# Altium schematic sheet rev-b1_case_boost.SchDoc
size 297 x 209 mm; Symbol: Drawing-Symbol_A4; @Project Name: Atrium_RevB1; @Page Count: 2; @Update Date: 2026-11-06; @Create Date: 2026-11-06; @Schematic Name: Case_Schematic; @Page No: 2; @Page Name: P1; Company: Local Forge; Version: V1.0; Page Size: A4; Drawn: Het Bhavsar; Device: Drawing-Symbol_A4; @Create Time: 01:02:57; @Update Time: 01:02:57; Border: 1; Width: 1170; Height: 825; Region Start: 1; X Region Count: 6; Y Region Count: 4; Blade Width: 10; Title Block Position: 3; @Board Name: Case
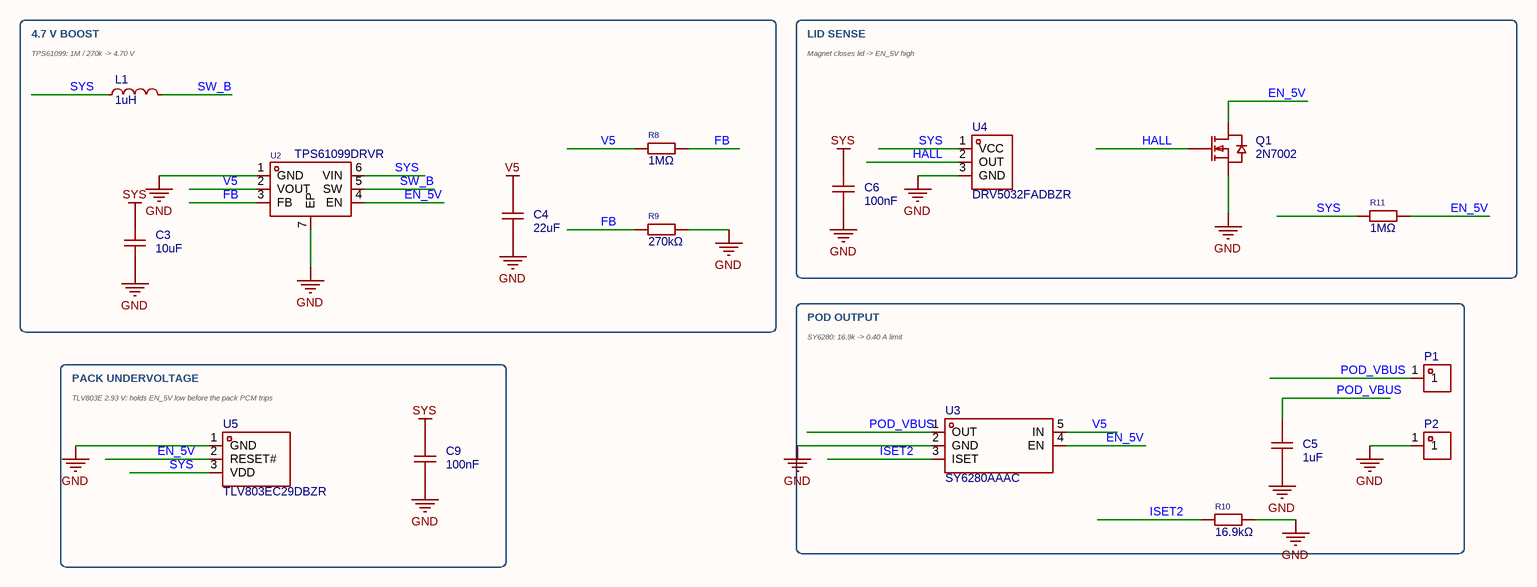
[diagram p0: rev-b1_case_boost.SchDoc]

## Parts
C3  10uF  [C0603]
C4  22uF  [C0603]
C5  1uF  [C0402]
C6  100nF  [C0402]
C9  100nF  [C0402]
L1  1uH  [L0806]
P1  BWCD-L4.5W2.0H2.3  [TESTPOINT-SMD_BD2.0-H4.5]  (value not drawn)
P2  BWCD-L4.5W2.0H2.3  [TESTPOINT-SMD_BD2.0-H4.5]  (value not drawn)
Q1  2N7002  [SOT-23-3_L2.9-W1.3-P1.90-LS2.4-BR]
R8  1MΩ  [R0402]
R9  270kΩ  [R0402]
R10  16.9kΩ  [R0402]
R11  1MΩ  [R0402]
U2  TPS61099DRVR  [WSON-6_L2.0-W2.0-P0.65-TL-EP]
U3  SY6280AAAC  [TSOT-23-5_L2.9-W1.6-P0.95-LS2.8-BL]
U4  DRV5032FADBZR  [SOT-23-3_L2.9-W1.3-P0.95-LS2.4-BR]
U5  TLV803EC29DBZR  [SOT-23-3_L2.9-W1.3-P1.90-LS2.4-BR]

## Blocks framed on the sheet
4.7 V BOOST: C3 C4 L1 R8 R9 U2
LID SENSE: C6 Q1 R11 U4
POD OUTPUT: C5 P1 P2 R10 U3
PACK UNDERVOLTAGE: C9 U5

## Nets
GND: C3.2 C4.2 C5.2 C6.2 C9.2 P2.1 Q1.2(S) R9.2 R10.2 U2.1(GND) U2.7(EP) U3.2(GND) U4.3(GND) U5.1(GND)
SYS: C3.1 C6.1 C9.1 L1.1 R11.1 U2.6(VIN) U4.1(VCC) U5.3(VDD)
V5: C4.1 R8.1 U2.2(VOUT) U3.5(IN)
EN_5V: Q1.3(D) R11.2 U2.4(EN) U3.4(EN) U5.2(RESET#)
FB: R8.2 R9.1 U2.3(FB)
HALL: Q1.1(G) U4.2(OUT)
ISET2: R10.1 U3.3(ISET)
POD_VBUS: C5.1 P1.1 U3.1(OUT)
SW_B: L1.2 U2.5(SW)

## Notes on the sheet
- (near L1) TPS61099: 1M / 270k -> 4.70 V
- Magnet closes lid -> EN_5V high
- SY6280: 16.9k -> 0.40 A limit
- (near U5) TLV803E 2.93 V: holds EN_5V low before the pack PCM trips
- Create at
- 2026-11-06
- Schematic
- Board
- Case_Schematic
- Case
- Update at
- Page
- P1
- Drawn
- Reviewed
- Het Bhavsar
- Atrium_RevB1
- Version
- V1.0
- Size
- A4
- Page  2  Total  2
- Local Forge

## Library data of the parts
C3 = CL10A106KP8NNNC: Capacitance:10uF Tolerance:±10% Tolerance:±10% Voltage Rating:10V Temperature Coefficient:X5R; Manufacturer: SAMSUNG(三星); Add into BOM: yes; Tolerance: ±10%; Voltage Rating: 10V; Temperature Coefficient: X5R; ModelId: 624118aa3cc7497086c383c2d72e08520819f05c4eef4c71ace90d822a990e87; ModelName: C0603_L1.6-W0.8-H0.8; ModelTransform: 62.992,31.496,0,0,0,0,0,0,0; Symbol: CL10A106KP8NNNC; Device: CL10A106KP8NNNC; Convert to PCB: yes; Manufacturer Part: CL10A106KP8NNNC; Supplier: LCSC; Supplier Part: C19702; LCSC Part Name: 10uF ±10% 10V; Supplier Footprint: 0603; JLCPCB Part Class: Basic Part; Datasheet: https://item.szlcsc.com/datasheet/CL10A106KP8NNNC/20411.html; Value: 10uF; FootprintName: C0603
C4 = CL10A226MQ8NRNC: Capacitance:22uF Tolerance:±20% Tolerance:±20% Voltage Rating:6.3V Temperature Coefficient:X5R; Manufacturer: SAMSUNG(三星); Add into BOM: yes; Tolerance: ±20%; Voltage Rating: 6.3V; Temperature Coefficient: X5R; ModelId: 624118aa3cc7497086c383c2d72e08520819f05c4eef4c71ace90d822a990e87; ModelName: C0603_L1.6-W0.8-H0.8; ModelTransform: 62.992,31.496,0,0,0,0,0,0,0; Symbol: CL10A226MQ8NRNC; Device: CL10A226MQ8NRNC; Convert to PCB: yes; Manufacturer Part: CL10A226MQ8NRNC; Supplier: LCSC; Supplier Part: C59461; LCSC Part Name: 22uF ±20% 6.3V; Supplier Footprint: 0603; JLCPCB Part Class: Basic Part; Datasheet: https://item.szlcsc.com/datasheet/CL10A226MQ8NRNC/60514.html; Value: 22uF; FootprintName: C0603
C5 = CL05A105KA5NQNC: Capacitance:1uF Tolerance:±10% Tolerance:±10% Voltage Rating:25V Temperature Coefficient:X5R; Manufacturer: SAMSUNG(三星); Add into BOM: yes; Tolerance: ±10%; Voltage Rating: 25V; Temperature Coefficient: X5R; ModelId: b7d13df3e9464d7a99d0651d1a5b4d570819f05c4eef4c71ace90d822a990e87; ModelName: C0402_L1.0-W0.5-H0.5; ModelTransform: 39.37,19.685,0,0,0,0,0,0,0; Symbol: CL05A105KA5NQNC; Device: CL05A105KA5NQNC; Convert to PCB: yes; Manufacturer Part: CL05A105KA5NQNC; Supplier: LCSC; Supplier Part: C52923; LCSC Part Name: 1uF ±10% 25V; Supplier Footprint: 0402; JLCPCB Part Class: Basic Part; Datasheet: https://item.szlcsc.com/datasheet/CL05A105KA5NQNC/53938.html; Value: 1uF; FootprintName: C0402
C6 = CL05B104KO5NNNC: Capacitance:100nF Tolerance:±10% Tolerance:±10% Voltage Rating:16V Temperature Coefficient:X7R; Manufacturer: SAMSUNG(三星); Add into BOM: yes; Tolerance: ±10%; Voltage Rating: 16V; Temperature Coefficient: X7R; ModelId: b7d13df3e9464d7a99d0651d1a5b4d570819f05c4eef4c71ace90d822a990e87; ModelName: C0402_L1.0-W0.5-H0.5; ModelTransform: 39.37,19.685,0,0,0,0,0,0,0; Symbol: CL05B104KO5NNNC; Device: CL05B104KO5NNNC; Convert to PCB: yes; Manufacturer Part: CL05B104KO5NNNC; Supplier: LCSC; Supplier Part: C1525; LCSC Part Name: 100nF ±10% 16V; Supplier Footprint: 0402; JLCPCB Part Class: Basic Part; Datasheet: https://item.szlcsc.com/datasheet/CL05B104KO5NNNC/1877.html; Value: 100nF; FootprintName: C0402
C9 = CL05B104KO5NNNC: Capacitance:100nF Tolerance:±10% Tolerance:±10% Voltage Rating:16V Temperature Coefficient:X7R; Manufacturer: SAMSUNG(三星); Add into BOM: yes; 3D Model: b7d13df3e9464d7a99d0651d1a5b4d570819f05c4eef4c71ace90d822a990e87; 3D Model Transform: 39.37,19.685,0,0,0,0,0,0,0; Tolerance: ±10%; Voltage Rating: 16V; Temperature Coefficient: X7R; ModelName: C0402_L1.0-W0.5-H0.5; Symbol: CL05B104KO5NNNC; Device: CL05B104KO5NNNC; Convert to PCB: yes; LCSC Part Name: 100nF ±10% 16V; Supplier Part: C1525; Manufacturer Part: CL05B104KO5NNNC; Supplier Footprint: 0402; JLCPCB Part Class: Basic Part; Datasheet: https://item.szlcsc.com/datasheet/CL05B104KO5NNNC/1877.html; Supplier: LCSC; Value: 100nF; FootprintName: C0402
L1 = DFE201610E-1R0M=P2: Inductance:1uH Tolerance:±20% Tolerance:±20% Current Rating:2.7A Current - Saturation (Isat):3.6A DC Resistance(DCR):57mΩ Q @ Frequency:- Frequency - Self Resonant:- Ratings:-; Manufacturer: muRata(村田); Add into BOM: yes; Tolerance: ±20%; Current Rating: 2.7A; Current - Saturation (Isat): 3.6A; DC Resistance(DCR): 57mΩ; ModelId: 50126e67425b4d0e857ac4e361b69b090819f05c4eef4c71ace90d822a990e87; ModelName: L0806_L2.0-W1.6-H1.0; ModelTransform: 78.74,62.992,0,0,0,0,0,0,0; Symbol: DFE201610E-1R0M=P2; Device: DFE201610E-1R0M=P2; Convert to PCB: yes; Manufacturer Part: DFE201610E-1R0M=P2; Supplier: LCSC; Supplier Part: C161082; LCSC Part Name: 1uH ±20% 3.6A; Supplier Footprint: 0806; JLCPCB Part Class: Extended Part; Datasheet: https://atta.szlcsc.com/upload/public/pdf/source/20180329/C161082_B32C8834554668ECFD54206075068FE7.pdf; Value: 1uH; Q @ Frequency: -; Frequency - Self Resonant: -; Ratings: -; FootprintName: L0806
P1 P2 = BWCD-L4.5W2.0H2.3: Type:Pogo Pin Number of Pins:1P Overall Length/Height:4.5mm Contact Resistance:30mΩ Elastic Life:1万次 Current Rating:1.5A Voltage Rating:36V Contact Material:Brass Contact Plating:Gold Operating Temperature:-45℃~+85℃ Operating Temperature:-45℃~+85℃; Manufacturer: BAT WIRELESS(蝙蝠无线); Add into BOM: yes; Overall Length/Height: 4.5mm; Contact Resistance: 30mΩ; Elastic Life: 1万次; Current Rating: 1.5A; Voltage Rating: 36V; Symbol: BWCD-L4.5W2.0H2.3; Device: BWCD-L4.5W2.0H2.3; Convert to PCB: yes; Manufacturer Part: BWCD-L4.5W2.0H2.3; Supplier: LCSC; Supplier Part: C2826546; LCSC Part Name: 天线顶针; Supplier Footprint: SMD,D=2mm; JLCPCB Part Class: Extended Part; Datasheet: https://item.szlcsc.com/datasheet/BWCD-L4.5W2.0H2.3/2970176.html; Type: Pogo Pin; Number of Pins: 1P; Contact Material: Brass; Contact Plating: Gold; Operating Temperature: -45℃~+85℃; FootprintName: TESTPOINT-SMD_BD2.0-H4.5
Q1 = 2N7002_C8545: Number:1 N-channel Drain to Source Voltage:60V Current - Continuous Drain(Id):115mA RDS(on):5Ω@10V Pd - Power Dissipation:225mW Gate Threshold Voltage (Vgs(th)):2.5V Gate Charge(Qg):- Input Capacitance(Ciss):50pF Reverse Transfer Capacitance (Crss@Vds):5p; Manufacturer: CJ(江苏长电/长晶); Add into BOM: yes; Drain to Source Voltage: 60V; Current - Continuous Drain(Id): 115mA; RDS(on): 5Ω@10V; Pd - Power Dissipation: 225mW; Gate Threshold Voltage (Vgs(th)): 2.5V; Input Capacitance(Ciss): 50pF; Reverse Transfer Capacitance (Crss@Vds): 5pF; Output Capacitance(Coss): 25pF; Vgs: ±20V; ModelId: 62a57c6760504a01965db6419a6d07df0819f05c4eef4c71ace90d822a990e87; ModelName: SOT-23-3P_L2.9-W1.3-H1.0-LS2.4-P0.95; ModelTransform: 98.425,114.173,0,180,0,0,0.0005,-0.0005,0; Symbol: 2N7002; Device: 2N7002_C8545; Convert to PCB: yes; Manufacturer Part: 2N7002; Supplier: LCSC; Supplier Part: C8545; LCSC Part Name: 1个N沟道 耐压:60V 电流:115mA; Supplier Footprint: SOT-23; JLCPCB Part Class: Basic Part; Datasheet: https://item.szlcsc.com/datasheet/2N7002/9040.html; Number: 1 N-channel; Gate Charge(Qg): -; Operating Temperature: -; Configuration: -; Type: N-Channel; FootprintName: SOT-23-3_L2.9-W1.3-P1.90-LS2.4-BR
R8 R11 = 0402WGF1004TCE: Type:Thick Film Resistor Resistance:1MΩ Tolerance:±1% Tolerance:±1% Power(Watts):62.5mW Voltage-Supply(Max):50V Temperature Coefficient:±100ppm/℃ Temperature Coefficient:±100ppm/℃ Operating Temperature:-55℃~+155℃ Operating Temperature:-55℃~+155℃; Manufacturer: UNI-ROYAL(厚声); Add into BOM: yes; Tolerance: ±1%; Power(Watts): 62.5mW; Voltage-Supply(Max): 50V; ModelId: efdecb7dae4442949d28eecaf748420f0819f05c4eef4c71ace90d822a990e87; ModelName: R0402_L1.0-W0.5-H0.4; ModelTransform: 39.37,19.685,0,0,0,0,0,0,0; Symbol: 0402WGF1004TCE; Device: 0402WGF1004TCE; Convert to PCB: yes; Manufacturer Part: 0402WGF1004TCE; Supplier: LCSC; Supplier Part: C26083; Value: 1MΩ; JLCPCB Part Class: Basic Part; LCSC Part Name: 1MΩ ±1% 62.5mW 厚膜电阻; Supplier Footprint: 0402; Datasheet: https://item.szlcsc.com/datasheet/0402WGF1004TCE/26826.html; Type: Thick Film Resistor; Temperature Coefficient: ±100ppm/℃; Operating Temperature: -55℃~+155℃; FootprintName: R0402
R9 = 0402WGF2703TCE: Type:Thick Film Resistors Resistance:270kΩ Tolerance:±1% Tolerance:±1% Power(Watts): Overload Voltage (Max): Temperature Coefficient:±100ppm/℃ Temperature Coefficient:±100ppm/℃ Operating Temperature Range:-55℃~+155℃ Operating Temperature Range:-55℃~+155℃; Manufacturer: UNI-ROYAL(厚声); Add into BOM: yes; Tolerance: ±1%; ModelId: efdecb7dae4442949d28eecaf748420f0819f05c4eef4c71ace90d822a990e87; ModelName: R0402_L1.0-W0.5-H0.4; ModelTransform: 39.37,19.685,0,0,0,0,0,0,0; Symbol: 0402WGF2703TCE; Device: 0402WGF2703TCE; Convert to PCB: yes; Manufacturer Part: 0402WGF2703TCE; Supplier: LCSC; Supplier Part: C25770; Value: 270kΩ; JLCPCB Part Class: Extended Part; LCSC Part Name: 270kΩ ±1% 62.5mW 厚膜电阻; Supplier Footprint: 0402; Datasheet: https://atta.szlcsc.com/upload/public/pdf/source/20200306/C422600_1E6D84923E4A46A82E41ADD87F860B5C.pdf; Type: Thick Film Resistors; Temperature Coefficient: ±100ppm/℃; Operating Temperature Range: -55℃~+155℃; FootprintName: R0402
R10 = 0402WGF1692TCE: Type:Thick Film Resistor Resistance:16.9kΩ Tolerance:±1% Tolerance:±1% Power(Watts):62.5mW Voltage-Supply(Max):50V Temperature Coefficient:±100ppm/℃ Temperature Coefficient:±100ppm/℃ Operating Temperature:-55℃~+155℃ Operating Temperature:-55℃~+155℃; Manufacturer: UNI-ROYAL(厚声); Add into BOM: yes; Tolerance: ±1%; Power(Watts): 62.5mW; Voltage-Supply(Max): 50V; ModelId: efdecb7dae4442949d28eecaf748420f0819f05c4eef4c71ace90d822a990e87; ModelName: R0402_L1.0-W0.5-H0.4; ModelTransform: 39.37,19.685,0,0,0,0,0,0,0; Symbol: 0402WGF1692TCE; Device: 0402WGF1692TCE; Convert to PCB: yes; Manufacturer Part: 0402WGF1692TCE; Supplier: LCSC; Supplier Part: C25858; Value: 16.9kΩ; JLCPCB Part Class: Extended Part; LCSC Part Name: 16.9kΩ ±1% 62.5mW 厚膜电阻; Supplier Footprint: 0402; Datasheet: https://item.szlcsc.com/datasheet/0402WGF1692TCE/26601.html; Type: Thick Film Resistor; Temperature Coefficient: ±100ppm/℃; Operating Temperature: -55℃~+155℃; FootprintName: R0402
U2 = TPS61099DRVR: Function:Boost Voltage - Supply:700mV~5.5V Voltage - Supply:700mV~5.5V Output Voltage:1.8V~5.5V Output Voltage:1.8V~5.5V Output Current:- Frequency - Switching:- Frequency - Switching:- Operating Temperature:-40℃~+150℃@(TJ) Operating Temperature:-40℃~+150; Manufacturer: TI(德州仪器); Add into BOM: yes; Function: Boost; Number of Outputs: 1; Quiescent Current: 1uA; Switch tube (built-in/external): Built-in; Output Type: Adjustable; ModelId: 8444490de3b54ad88c9bb3ba8e0898870819f05c4eef4c71ace90d822a990e87; ModelName: WSON-6_L2.0-W2.0-H0.8-P0.65; ModelTransform: 79.527,78.74,0,0,0,0,0,0,0; Symbol: TPS61099DRVR; Device: TPS61099DRVR; Convert to PCB: yes; Manufacturer Part: TPS61099DRVR; Supplier: LCSC; Supplier Part: C2842395; JLCPCB Part Class: Extended Part; LCSC Part Name: 升压型 700mV~5.5V; Supplier Footprint: WSON-6-EP(2x2); Datasheet: https://www.ti.com/cn/lit/ds/symlink/tps61099.pdf; Voltage - Supply: 700mV~5.5V; Output Voltage: 1.8V~5.5V; Output Current: -; Frequency - Switching: -; Operating Temperature: -40℃~+150℃@(TJ); Synchronous Rectifier: Yes; Topology: Boost; Features: Light load efficient mode；Cycle-by-cycle current limiting；Overcurrent Protection；Load disconnect; FootprintName: WSON-6_L2.0-W2.0-P0.65-TL-EP
U3 = SY6280AAAC: Type:High Side Switch Number of Channels:1 Control Input Logic:Active High Voltage - Supply:2.4V~5.5V Voltage - Supply:2.4V~5.5V Maximum Continuous Current:2A RDS(on):63mΩ Features:Overcurrent Protection；Short-Circuit  Protection；Reverse current blocking；; Manufacturer: Silergy(矽力杰); Add into BOM: yes; Number of Channels: 1; Maximum Continuous Current: 2A; RDS(on): 63mΩ; ModelId: ca93c613a18b4c5f914a9a05dc135eb50819f05c4eef4c71ace90d822a990e87; ModelName: TSOT-23-5_L2.9-W1.6-H1.00-LS2.8-P0.95; ModelTransform: 110.45568,114.173,0,90,0,0,0.0005,0,0; Symbol: SY6280AAAC; Device: SY6280AAAC; Convert to PCB: yes; Manufacturer Part: SY6280AAAC; Supplier: LCSC; Supplier Part: C207620; LCSC Part Name: 5.5V, 2A低损耗功率分配开关; Supplier Footprint: SOT-23-5; JLCPCB Part Class: Extended Part; Datasheet: https://item.szlcsc.com/datasheet/SY6280AAAC/208836.html; Type: High Side Switch; Control Input Logic: Active High; Voltage - Supply: 2.4V~5.5V; Features: Overcurrent Protection；Short-Circuit  Protection；Reverse current blocking；Output discharge function；Over temperature protection；Under-voltage lockout; Operating Temperature	-: -40℃~+125℃; FootprintName: TSOT-23-5_L2.9-W1.6-P0.95-LS2.8-BL
U4 = DRV5032FADBZR: Type:Omnipolar Voltage - Supply:1.65V~5.5V Voltage - Supply:1.65V~5.5V Operation Points:±4.8mT Operation Points:±4.8mT Release Points:±5Gs Release Points:±5Gs Operating Current:1.6uA Output Type:Push-pull Sample Frequency:20Hz Operating Temperature:-40℃~+; Manufacturer: TI(德州仪器); Add into BOM: yes; Operation Points: ±4.8mT; Release Points: ±5Gs; Operating Current: 1.6uA; Sample Frequency: 20Hz; ModelId: 62a57c6760504a01965db6419a6d07df0819f05c4eef4c71ace90d822a990e87; ModelName: SOT-23-3P_L2.9-W1.3-H1.0-LS2.4-P0.95; ModelTransform: 98.425,114.173,0,180,0,0,0.0005,-0.0005,0; Symbol: DRV5032FADBZR; Device: DRV5032FADBZR; Convert to PCB: yes; Manufacturer Part: DRV5032FADBZR; Supplier: LCSC; Supplier Part: C140921; LCSC Part Name: 数字锁存霍尔效应传感器; Supplier Footprint: SOT-23; JLCPCB Part Class: Extended Part; Datasheet: https://www.ti.com/cn/lit/ds/symlink/drv5032.pdf; Type: Omnipolar; Voltage - Supply: 1.65V~5.5V; Output Type: Push-pull; Operating Temperature: -40℃~+85℃; Features: Built-in oscillator; FootprintName: SOT-23-3_L2.9-W1.3-P0.95-LS2.4-BR
U5 = TLV803EC29DBZR: ChipType:Simple Reset/Power-On Reset Output Type:Open-drain Voltage - Supply:1.7V~6V Voltage - Supply:1.7V~6V Reset Active Level:Active Low Threshold Voltage:2.93V Number of Voltages Monitored:1 Reset Timeout:6.5ms Operating Temperature:-40℃~+125℃ Operati; Manufacturer: TI(德州仪器); Add into BOM: yes; Threshold Voltage: 2.93V; Number of Voltages Monitored: 1; Reset Timeout: 6.5ms; Quiescent Current: 250nA; ModelId: 62a57c6760504a01965db6419a6d07df0819f05c4eef4c71ace90d822a990e87; ModelName: SOT-23-3P_L2.9-W1.3-H1.0-LS2.4-P0.95; ModelTransform: 98.425,114.173,0,180,0,0,0.0005,-0.0005,0; Symbol: TLV803EC29DBZR; Device: TLV803EC29DBZR; Convert to PCB: yes; Manufacturer Part: TLV803EC29DBZR; Supplier: LCSC; Supplier Part: C2867948; LCSC Part Name: 低功耗和小尺寸电源电压监控器; Supplier Footprint: SOT-23; JLCPCB Part Class: Extended Part; Datasheet: https://www.ti.com/cn/lit/ds/symlink/tlv803e.pdf; ChipType: Simple Reset/Power-On Reset; Output Type: Open-drain; Voltage - Supply: 1.7V~6V; Reset Active Level: Active Low; Operating Temperature: -40℃~+125℃; FootprintName: SOT-23-3_L2.9-W1.3-P1.90-LS2.4-BR